# EAGLE design rp2040zero_display_buttons (EAGLE 6.2)
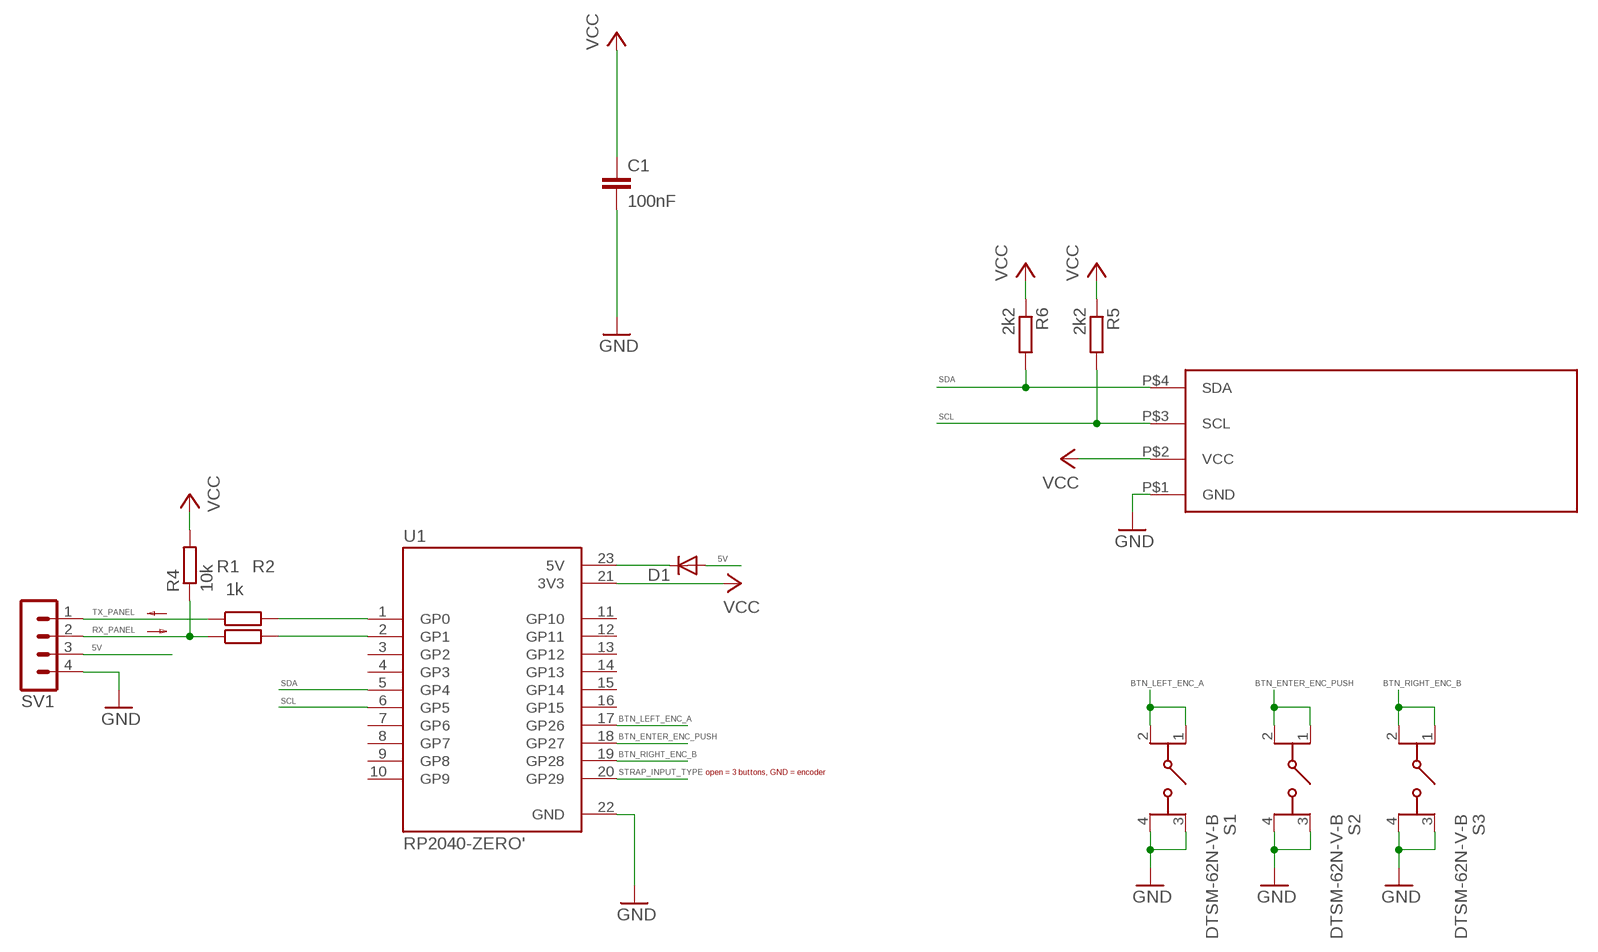
[diagram p0: schematic, sheet 1]

## Parts
C1  100nF  C-EUC0603  [C0603]
D1  SK110-DIO  DIODE-DO214AC  [DO214AC]
R1  1k  R-EU_R0603  [R0603]
R2  1k  R-EU_R0603  [R0603]
R4  10k  R-EU_R0603  [R0603]
R5  2k2  R-EU_R0603  [R0603]
R6  2k2  R-EU_R0603  [R0603]
S1  DTSM-62N-V-B  [DTSM62NVB]
S2  DTSM-62N-V-B  [DTSM62NVB]
S3  DTSM-62N-V-B  [DTSM62NVB]
SV1  MA04-1  [MA04-1]
U1  RP2040-ZERO'  [MODULE_RP2040-ZERO]
U$1  OLED  [SIP]

## Nets
5V: D1.A SV1.3
BTN_ENTER_ENC_PUSH: S2.1(COM_1) S2.2(COM_2) U1.18(GP27)
BTN_LEFT_ENC_A: S1.1(COM_1) S1.2(COM_2) U1.17(GP26)
BTN_RIGHT_ENC_B: S3.1(COM_1) S3.2(COM_2) U1.19(GP28)
GND: C1.2 S1.3(NO_1) S1.4(NO_2) S2.3(NO_1) S2.4(NO_2) S3.3(NO_1) S3.4(NO_2) SV1.4 U1.22(GND) U$1.P$1(GND)
N$1: R1.2 U1.1(GP0)
N$2: R2.2 U1.2(GP1)
N$3: D1.C U1.23(5V)
RX_PANEL: R2.1 R4.1 SV1.2
SCL: R5.2 U1.6(GP5) U$1.P$3(SCL)
SDA: R6.2 U1.5(GP4) U$1.P$4(SDA)
STRAP_INPUT_TYPE: U1.20(GP29)
TX_PANEL: R1.1 SV1.1
VCC: C1.1 R4.2 R5.1 R6.1 U1.21(3V3) U$1.P$2(VCC)
Unconnected: U1.3(GP2) U1.4(GP3) U1.7(GP6) U1.8(GP7) U1.9(GP8) U1.10(GP9) U1.11(GP10) U1.12(GP11) U1.13(GP12) U1.14(GP13) U1.15(GP14) U1.16(GP15)

## Notes on the sheet
- open = 3 buttons, GND = encoder

## Library data of the parts
C1 = rcl:C-EU: CAPACITOR, European symbol
D1 = diode:DIODE-: DIODE
R1 R2 R4-R6 = resistor:R-EU_: RESISTOR, European symbol
S1-S3 = DTSM-62N-V-B:DTSM-62N-V-B: Tactile Switches TACTILE SWITCH 6X6MM Source: Datasheet <http://www.dip.com.tw/en/en-product-information/en-switch004/item/2464-dtsm-g-6>; DESCRIPTION: Tactile Switches TACTILE SWITCH 6X6MM; HEIGHT: 5.1mm; MANUFACTURER_NAME: Diptronics; MANUFACTURER_PART_NUMBER: DTSM-62N-V-B
SV1 = con-lstb:MA04-1: PIN HEADER; OC_FARNELL: unknown; OC_NEWARK: unknown
U1 = RP2040-ZERO:RP2040-ZERO: Check availability <https://pricing.snapeda.com/parts/RP2040-ZERO/Waveshare%20Electronics/view-part?ref=eda>; AVAILABILITY: Not in stock; CHECK_PRICES: https://www.snapeda.com/parts/RP2040-ZERO/Waveshare+Electronics/view-part/?ref=eda; DESCRIPTION: Low-Cost, High-Performance Pico-Like MCU Board Based On Raspberry Pi Microcontroller RP2040; MF: Waveshare Electronics; MP: RP2040-ZERO; PACKAGE: Package; PRICE: None; SNAPEDA_LINK: https://www.snapeda.com/parts/RP2040-ZERO/Waveshare+Electronics/view-part/?ref=snap
U$1 = OLED:OLED: I2C 0.91"128x32 OLED

## Board
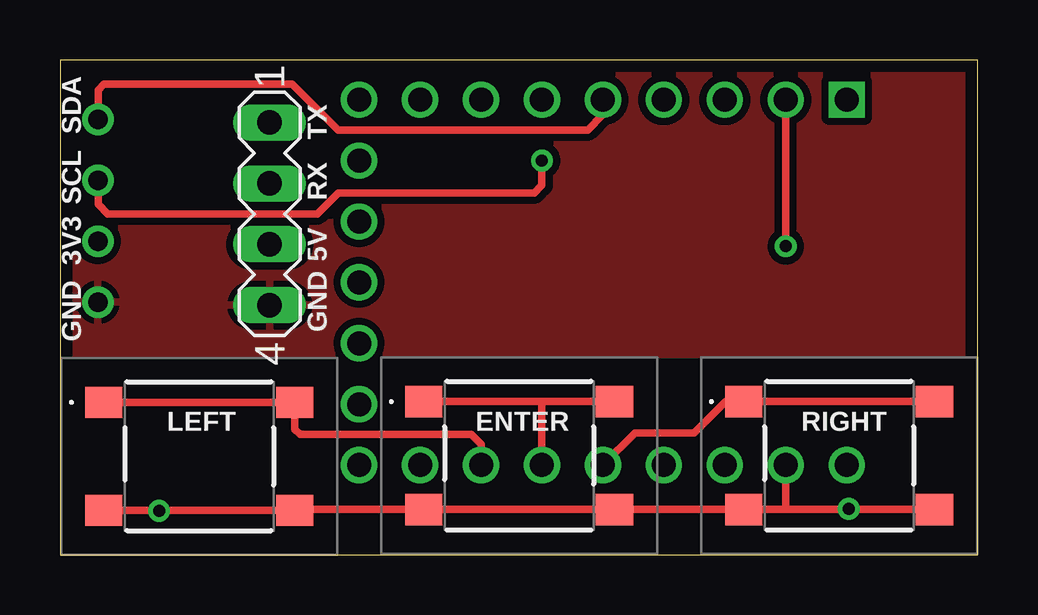
[diagram p1: board, top side]
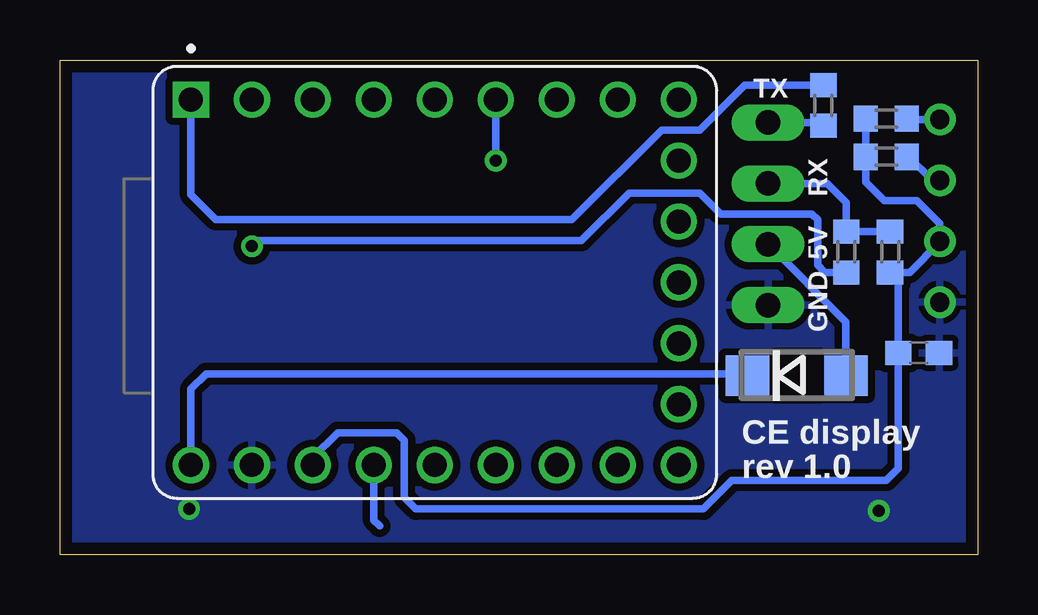
[diagram p2: board, bottom side, seen from below]

Size 38.24 x 20.62 mm. Coordinates in mm from the lower left corner, seen from the top.
Outline: 0,0 38.24,0 38.24,20.62 0,20.62 0,0
Copper layers (1*16): Top 0.035mm / dielectric 1.5mm / Bottom 0.035mm
Design rules: minimum track width 0.2mm, minimum drill 0.5mm, track to track 0.2mm, track to pad 0.2mm, pad to pad 0.2mm, via to via 0.2mm, smd to smd 0.2mm, copper to edge 0.5mm, drill to drill 8mil, minimum pad ring 10mil, minimum via ring 8mil, stop-mask expansion 4mil, vias tented up to drill 0mil, thermal gap 10mil
bRestrict: area 6.6,6.6 to 8.4,8.3

### Footprints (pad centres in the part's own frame; a part is rotated, then mirrored left to right if it is on the bottom)
C0603 = smd 1.1 x 1: 1 -0.85,0; 2 0.85,0
DO214AC = smd 1.8 x 1.7: A 2.05,0; C -2.05,0
R0603 = smd 1 x 1.1: 1 -0.85,0; 2 0.85,0
DTSM62NVB = smd 1.55 x 1.3: 1 -3.975,2.25; 2 3.975,2.25; 3 -3.975,-2.25; 4 3.975,-2.25
MA04-1 = drill 1.016 long: 1 -3.81,0; 2 -1.27,0; 3 1.27,0; 4 3.81,0
MODULE_RP2040-ZERO = drill 1 square: 1 7.62,10.16 | drill 1: 2 7.62,7.62; 3 7.62,5.08; 4 7.62,2.54; 5 7.62,0; 6 7.62,-2.54; 7 7.62,-5.08; 8 7.62,-7.62; 9 7.62,-10.16; 10 5.08,-10.16; 11 2.54,-10.16; 12 0,-10.16; 13 -2.54,-10.16; 14 -5.08,-10.16; 15 -7.62,-10.16; 16 -7.62,-7.62; 17 -7.62,-5.08; 18 -7.62,-2.54; 19 -7.62,0; 20 -7.62,2.54; 21 -7.62,5.08; 22 -7.62,7.62; 23 -7.62,10.16
SIP = drill 0.8: P$1 -17.55,-4.16; P$2 -17.55,-1.62; P$3 -17.55,0.92; P$4 -17.55,3.46

### Placement (x,y rotation side)
C1  2.46,8.41 0 bottom
D1  7.54,7.46 0 bottom
R1  6.43,18.73 90 bottom
R2  5.48,12.62 270 bottom
R4  3.65,12.62 270 bottom
R5  3.81,16.59 0 bottom
R6  3.81,18.18 0 bottom
S1  5.8,4.1 0 top
S2  19.13,4.13 0 top
S3  32.46,4.13 0 top
SV1  8.73,14.21 270 top
U1  22.62,11.35 90 bottom
U$1  19.13,14.68 0 top

### Tracks (layer width: path | path; a pad name or v marks a point on that pad's centre or on a via)
5V
  Bottom 0.305: D1.A 5.49,9.7 SV1.3
BTN_ENTER_ENC_PUSH
  Top 0.305: S2.1 19.68,6.38 20.08,6.38 | 20.08,6.38 S2.2 | U1.18 20.08,6.38
BTN_LEFT_ENC_A
  Top 0.305: S1.1 S1.2 9.78,5.23 10,5 17.14,5 17.54,4.6 U1.17
BTN_RIGHT_ENC_B
  Top 0.305: S3.2 S3.1 27.73,6.38 26.43,5.08 23.97,5.08 U1.19
GND  (via drill 0.5)
  Top 0.305: S1.3 S1.4 9.8,1.88 14.9,1.88 S2.3 S2.4 S3.3 30.24,1.88 | 30.24,1.88 S3.4 | U1.22 30.24,1.88
  other vias: 4.13,1.83 32.86,1.91
  pour Top (isolate 0.305): 0,20.64 38.1,20.64 38.1,8.33 0,8.33
  pour Bottom (isolate 0.305): 38.18,20.56 38.18,0.08 0,0.08 0,20.56
N$1
  Bottom 0.305: R1.2 9.71,19.58 11.59,17.7 13.18,17.7 16.91,13.97 31.75,13.97 32.78,15 U1.1
N$2  (via drill 0.5)
  Top 0.305: v30.24,12.86 U1.2
  Bottom 0.305: v30.24,12.86 30.16,13.1 16.51,13.1 14.53,15.08 11.59,15.08 10.72,14.21 6.91,14.21 6.67,13.97 6.67,12.06 6.37,11.77 R2.2
N$3
  Bottom 0.305: D1.C 9.91,7.55 10.16,7.54 32.15,7.54 32.78,6.91 U1.23
RX_PANEL
  Bottom 0.305: R4.1 3.81,13.65 3.99,13.47 R2.1 5.48,14.68 6.27,15.48 SV1.2
SCL  (via drill 0.5)
  Top 0.305: v20.08,16.43 20.08,15.4 19.76,15.08 11.59,15.08 10.72,14.21 1.98,14.21 1.59,14.61 U$1.P$3
  Bottom 0.305: 1.58,15.64 U$1.P$3 1.9,15.63 2.3,16.03 R5.2 | U1.6 v20.08,16.43
SDA
  Top 0.305: U1.5 22.62,18.34 21.99,17.7 11.59,17.7 9.68,19.61 1.83,19.61 1.59,19.37 1.59,18.15 U$1.P$4
  Bottom 0.305: R6.2 2.96,18.14 U$1.P$4
STRAP_INPUT_TYPE
  Bottom 0.305: 24.92,1.19 25.16,1.43 U1.20
TX_PANEL
  Bottom 0.305: SV1.1 6.43,18.02 R1.1
VCC
  Bottom 0.305: R5.1 R6.1 | U1.21 27.7,4.05 26.67,5.08 24.21,5.08 23.89,4.76 23.89,2.38 23.42,1.91 11.43,1.91 10.24,3.1 3.81,3.1 3.31,3.6 C1.1 3.31,11.27 R4.2 2.83,11.77 1.58,13.03 U$1.P$2 1.58,13.8 2.54,14.76 3.89,14.76 4.66,15.53 R5.1 | 4.66,16.33 R5.1

### Text on the board
tNames: SDA | TX | SCL | RX | 3V3 | 5V | GND | GND | LEFT | ENTER | RIGHT
bNames: TX | RX | 5V | GND | CE display | rev 1.0